# Altium project iMX6 Rex Development Baseboard V1I1.PrjPcb (part 9 of 9)

## Sheet [17] - PWR IN, LEDS, BUTTONS, MECH.SchDoc
size A3; DocumentNumber: 2; SheetNumber: 17; SheetTotal: 20
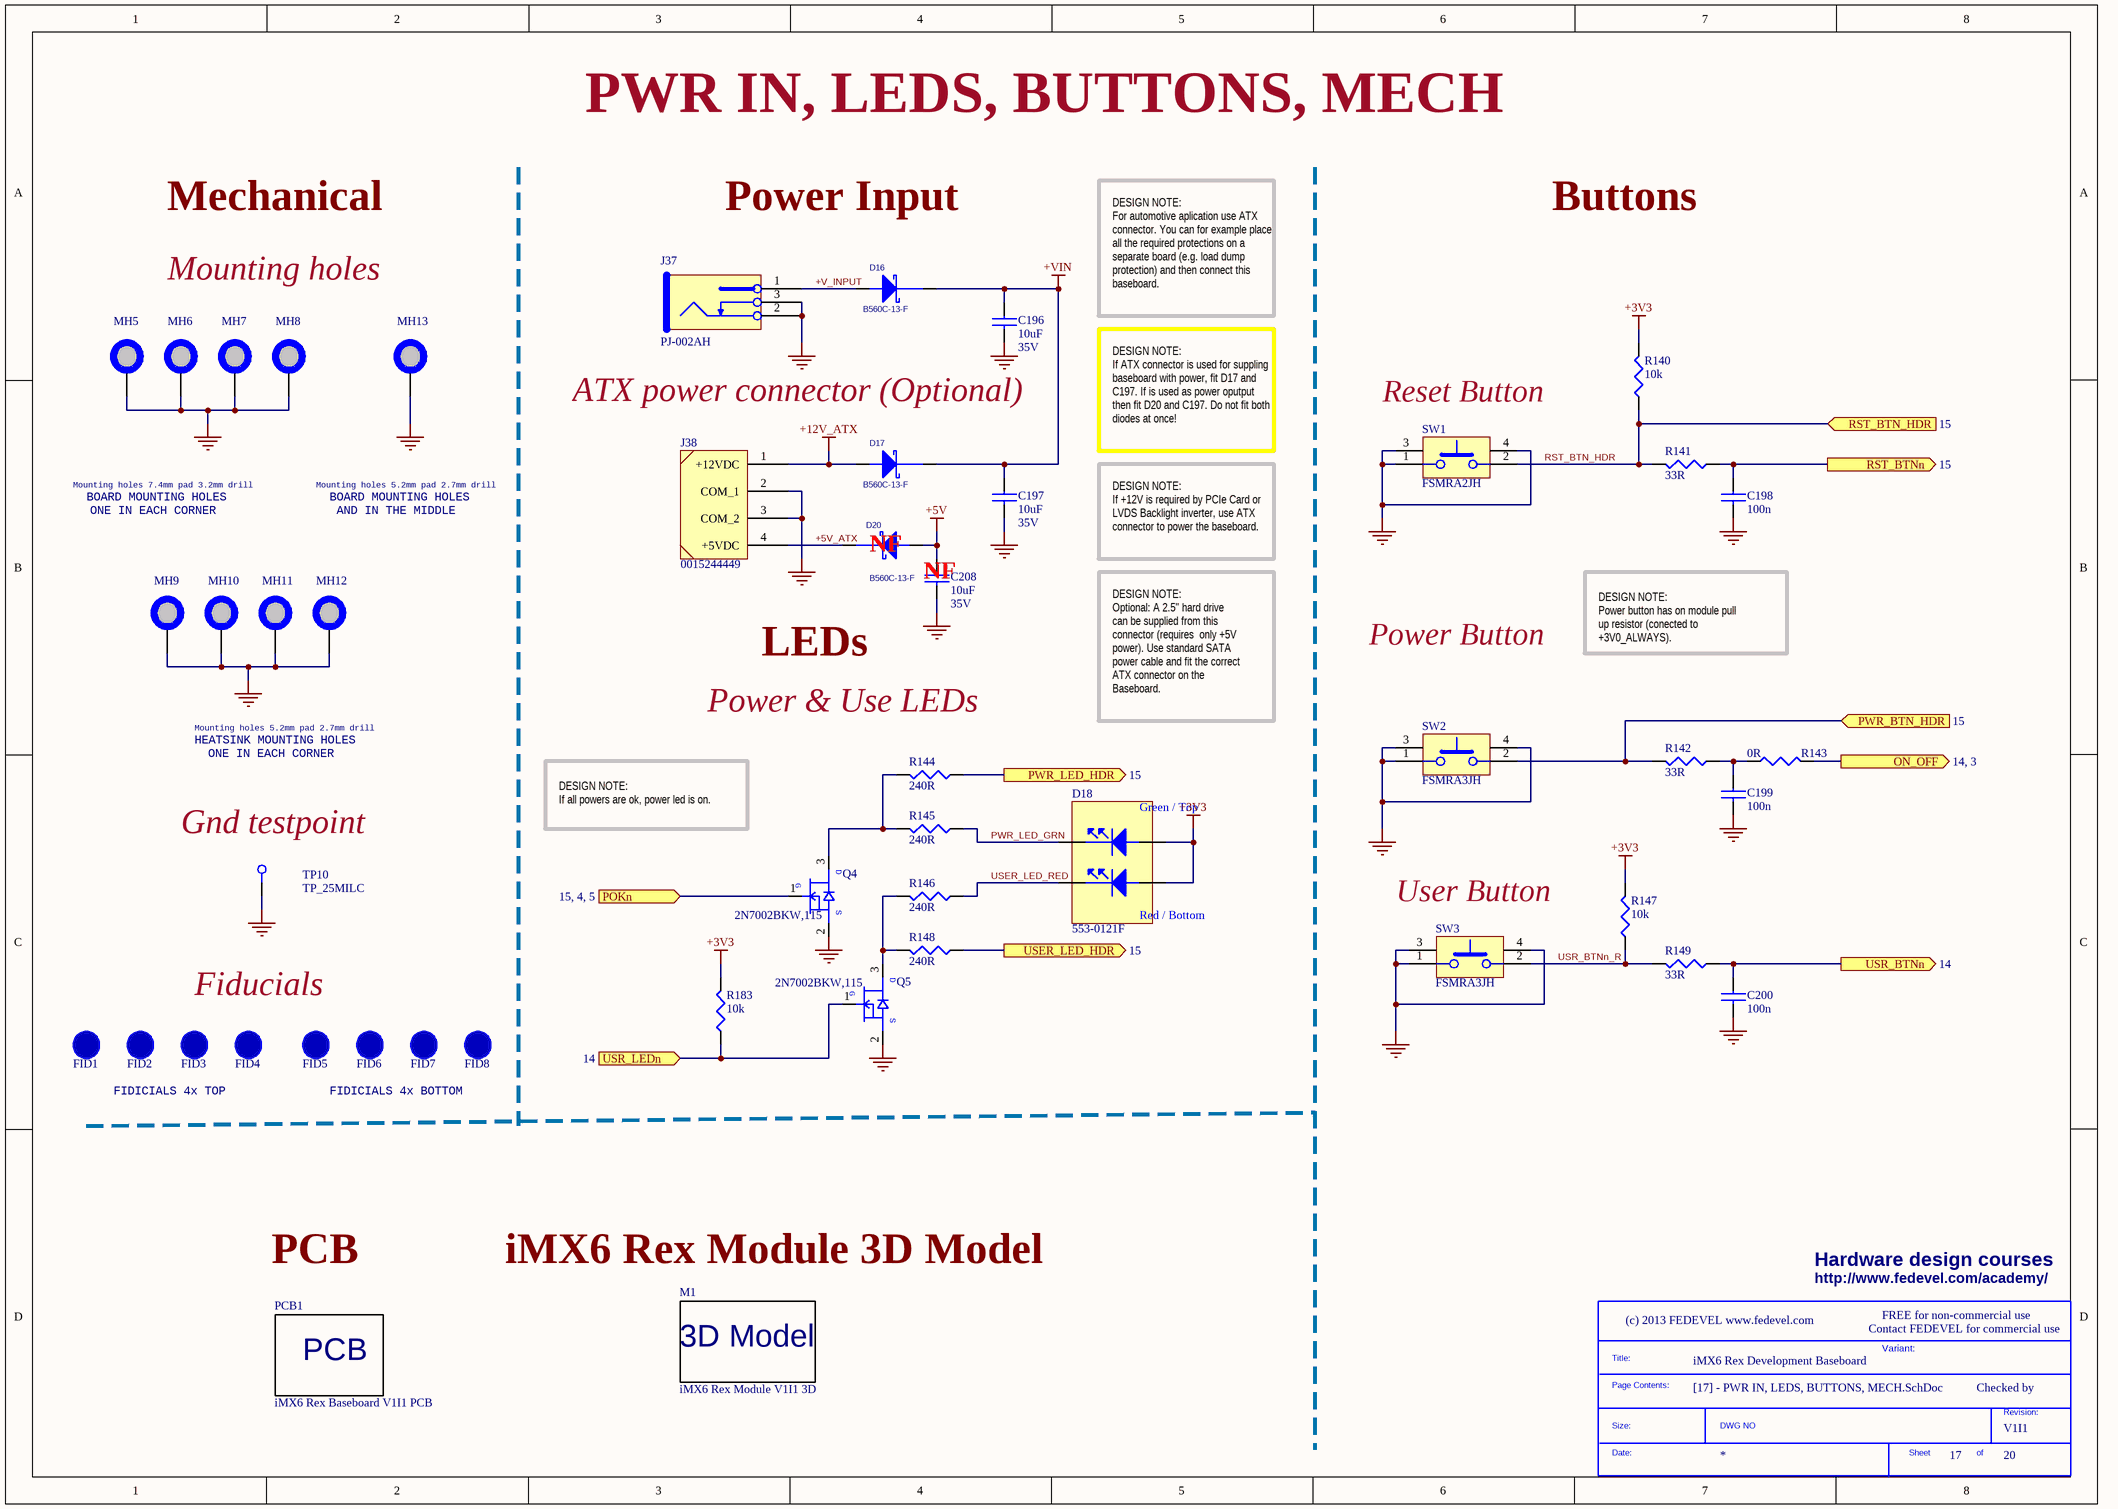
[diagram p23: [17] - PWR IN, LEDS, BUTTONS, MECH.SchDoc]

### Parts
(Parts that share a designator on the sheet are numbered #1, #2 ... from top to bottom, then left to right.)
*#19  SDTitleBlock  (value not drawn)  (graphical)
C196  10uF  Voltage - Rated: 35V  [C1206]
C197  10uF  Voltage - Rated: 35V  [C1206]
C198  100n  [C0402]
C199  100n  [C0402]
C200  100n  [C0402]
C208  10uF  Voltage - Rated: 35V  [C1206]
D16  B560C-13-F  [SMC]
D17  B560C-13-F  [SMC]
D18  553-0121F  [553-0121F]
D20  B560C-13-F  [SMC]
FID1  FID_1MMC  [FID_40X120D]  (value not drawn)  (no BOM)
FID2  FID_1MMC  [FID_40X120D]  (value not drawn)  (no BOM)
FID3  FID_1MMC  [FID_40X120D]  (value not drawn)  (no BOM)
FID4  FID_1MMC  [FID_40X120D]  (value not drawn)  (no BOM)
FID5  FID_1MMC  [FID_40X120D]  (value not drawn)  (no BOM)
FID6  FID_1MMC  [FID_40X120D]  (value not drawn)  (no BOM)
FID7  FID_1MMC  [FID_40X120D]  (value not drawn)  (no BOM)
FID8  FID_1MMC  [FID_40X120D]  (value not drawn)  (no BOM)
J37  PJ-002AH  [POWER_JACK_5.5_2.1MM_NS]
J38  0015244449  [015244449]
M1  iMX6 Rex Module V1I1 3D  [iMX6 Rex Module 3D]  (no BOM)
MH5  MH_7.4MMC_3.2MMD  [MH_7.4MMD_3.2MMD]  (value not drawn)  (no BOM)
MH6  MH_7.4MMC_3.2MMD  [MH_7.4MMD_3.2MMD]  (value not drawn)  (no BOM)
MH7  MH_7.4MMC_3.2MMD  [MH_7.4MMD_3.2MMD]  (value not drawn)  (no BOM)
MH8  MH_7.4MMC_3.2MMD  [MH_7.4MMD_3.2MMD]  (value not drawn)  (no BOM)
MH9  MH_5.2MMC_2.7MMD  [MH_5.2MMD_2.7MMD]  (value not drawn)  (no BOM)
MH10  MH_5.2MMC_2.7MMD  [MH_5.2MMD_2.7MMD]  (value not drawn)  (no BOM)
MH11  MH_5.2MMC_2.7MMD  [MH_5.2MMD_2.7MMD]  (value not drawn)  (no BOM)
MH12  MH_5.2MMC_2.7MMD  [MH_5.2MMD_2.7MMD]  (value not drawn)  (no BOM)
MH13  MH_5MMC_2.2MMD  [MH_5MMD_2.2MMD]  (value not drawn)  (no BOM)
PCB1  iMX6 Rex Baseboard V1I1 PCB  (mechanical)
Q4  2N7002BKW,115  [SC70_SOT323]
Q5  2N7002BKW,115  [SC70_SOT323]
R140  10k  [R0402]
R141  33R  [R0402]
R142  33R  [R0402]
R143  0R  [R0402]
R144  240R  [R0402]
R145  240R  [R0402]
R146  240R  [R0402]
R147  10k  [R0402]
R148  240R  [R0402]
R149  33R  [R0402]
R183  10k  [R0402]
SW1  FSMRA2JH  [FSMRA2JH]
SW2  FSMRA3JH  [FSMRA3JH]
SW3  FSMRA3JH  [FSMRA3JH]
TP10  TP_25MILC  [TP_25C]  (no BOM)

### Ports
ON_OFF (out, see 14, 3), POKn (see 15, 4, 5), PWR_BTN_HDR (in, see 15), PWR_LED_HDR (out, see 15), RST_BTN_HDR (in, see 15), RST_BTNn (out, see 15), USER_LED_HDR (out, see 15), USR_BTNn (out, see 14), USR_LEDn (in, see 14)

### Nets
+3V3: D18.2(ANODE) D18.4(ANODE) R140.2 R147.2 R183.2
+5V: C208.1 D20.2(ANODE)
+12V_ATX: D17.2(ANODE) J38.1(+12VDC)
+VIN: C196.1 C197.1 D16.1(cathode) D17.1(cathode)
GND: C196.2 C197.2 C198.2 C199.2 C200.2 C208.2 J37.2 J37.3 J38.2(COM_1) J38.3(COM_2) MH5.1 MH6.1 MH7.1 MH8.1 MH9.1 MH10.1 MH11.1 MH12.1 MH13.1 Q4.2(SOURCE) Q5.2(SOURCE) SW1.1 SW1.3(MECH1) SW1.4(MECH2) SW2.1 SW2.3(MECH1) SW2.4(MECH2) SW3.1 SW3.3(MECH1) SW3.4(MECH2) TP10.1
+5V_ATX: D20.1(cathode) J38.4(+5VDC)
+V_INPUT: D16.2(ANODE) J37.1
ON_OFF: R143.2 ; port ON_OFF
POKn: Q4.1(GATE) ; port POKn
PWR_BTN_HDR: R142.2 SW2.2 ; port PWR_BTN_HDR
PWR_LED_GRN: D18.3(cathode) R145.1
PWR_LED_HDR: R144.1 ; port PWR_LED_HDR
RST_BTN_HDR: R140.1 R141.2 SW1.2 ; port RST_BTN_HDR
RST_BTNn: C198.1 R141.1 ; port RST_BTNn
USER_LED_HDR: R148.1 ; port USER_LED_HDR
USER_LED_RED: D18.1(cathode) R146.1
USR_BTNn: C200.1 R149.1 ; port USR_BTNn
USR_BTNn_R: R147.1 R149.2 SW3.2
USR_LEDn: Q5.1(GATE) R183.1 ; port USR_LEDn
NetC199_1: C199.1 R142.1 R143.1
NetQ4_3: Q4.3(DRAIN) R144.2 R145.2
NetQ5_3: Q5.3(DRAIN) R146.2 R148.2

### Notes on the sheet
- PWR IN, LEDS, BUTTONS, MECH
- Mechanical
- Power Input
- Buttons
- Mounting holes
- DESIGN NOTE:
  For automotive aplication use ATX connector. You can for example place all the required protections on a separate board (e.g. load dump protection) and then connect this baseboard.
- ATX power connector (Optional)
- DESIGN NOTE:
  If ATX connector is used for suppling baseboard with power, fit D17 and C197. If is used as power oputput then fit D20 and C197. Do not fit both diodes at once!
- (near SW1) Reset Button
- Mounting holes 7.4mm pad 3.2mm drill
- BOARD MOUNTING HOLES
- ONE IN EACH CORNER
- Mounting holes 5.2mm pad 2.7mm drill
- AND IN THE MIDDLE
- (near D20) NF
- (near C208) NF
- DESIGN NOTE:
  If +12V is required by PCIe Card or LVDS Backlight inverter, use ATX connector to power the baseboard.
- Power Button
- DESIGN NOTE:
  Power button has on module pull
  up resistor (conected to
  +3V0_ALWAYS).
- Power & Use LEDs
- LEDs
- DESIGN NOTE:
  Optional: A 2.5" hard drive
  can be supplied from this
  connector (requires  only +5V
  power). Use standard SATA
  power cable and fit the correct
  ATX connector on the
  Baseboard.
- HEATSINK MOUNTING HOLES
- (near TP10) Gnd testpoint
- DESIGN NOTE:
  If all powers are ok, power led is on.
- User Button
- Fiducials
- FIDICIALS 4x TOP
- FIDICIALS 4x BOTTOM
- Hardware design courses
- PCB
- iMX6 Rex Module 3D Model
- http://www.fedevel.com/academy/
- Contact FEDEVEL for commercial use
- FREE for non-commercial use
- Variant:
- Checked by
- (in symbol 2N7002BKW,115) D; G; S
- (in symbol 553-0121F) Green / Top; Red / Bottom
- (in symbol PCB_iMX6_REX_Baseboard_V1I1) PCB
- (in symbol SDTitleBlock) Title:; Page Contents:; Revision:; Size:; DWG NO; Date:; Sheet; of

### Library data of the parts
C196 C197 C208 = GRM31CR6YA106KA12L: as C184 on sheet [16] - POWERS 5V, 3V3; Category: Capacitors; Supplier Part Number: 490-5524-1-ND; Manufacturer Part Number: GRM31CR6YA106KA12L; Operating Temperature: -55°C ~ 85°C; Package / Case: 1206 (3216 Metric); Price 1k [$]: 0.19448; Value: 10uF; .Checked SCH: used; Supplier: Digikey; Supplier 1: Digi-Key; Supplier Part Number 1: 490-5524-1-ND; RoHS: RoHS Compliant; Stock 1: 76334; Pricing 1: 1=0.6, 10=0.501, 50=0.359, 100=0.3142, 250=0.24684, 500=0.2244, 1000=0.17952 (USD); Temperature Coefficient: X5R; Mounting Type: Surface Mount, MLCC; Applications: General Purpose; Ratings: -; Size / Dimension: 0.126" L x 0.063" W (3.20mm x 1.60mm); Height - Seated (Max): -; Thickness (Max): 0.071" (1.80mm); Lead Spacing: -; Features: -; Packaging: Cut Tape (CT); Lead Style: -; ComponentLink1URL: http://www.murata.com/products/catalog/pdf/c02e.pdf; ComponentLink1Description: http://www.murata.com/products/catalog/pdf/c02e.pdf
C198-C200 = C1005X5R1H104K: as C151-C155 on sheet [14] - RTC, EEPROM, GPIO, TOUCH SCREEN; Category: Capacitors; Supplier Part Number: 445-5942-1-ND; Manufacturer Part Number: C1005X5R1H104K; Operating Temperature: -55°C ~ 85°C; Package / Case: 0402 (1005 Metric); Price 1k [$]: 0.02340; .Checked SCH: used; Voltage - Rated: 50V; Supplier: Digikey; Supplier 1: Digi-Key; Supplier Part Number 1: 445-5942-1-ND; RoHS: RoHS Compliant; Stock 1: 106926; Pricing 1: 1=0.27, 10=0.18, 100=0.072, 250=0.05176, 500=0.0369, 1000=0.027 (USD); Tolerance: ±10%; Temperature Coefficient: X5R; Mounting Type: Surface Mount, MLCC; Applications: General Purpose; Ratings: -; Size / Dimension: 0.039" L x 0.020" W (1.00mm x 0.50mm); Height - Seated (Max): -; Thickness (Max): 0.022" (0.55mm); Lead Spacing: -; Features: -; Packaging: Cut Tape (CT); Lead Style: -; ComponentLink1URL: http://www.tdk.co.jp/tefe02/e412_c.pdf; ComponentLink1Description: http://www.tdk.co.jp/tefe02/e412_c.pdf
D16 D17 D20 = B560C-13-F: DIODE SCHOTTKY 60V 5A SMC; Manufacturer: Diodes Inc; .Checked PCB: used; Voltage - Forward (Vf) (Max) @ If: 700mV @ 5A; Speed: Fast Recovery =< 500ns, > 200mA (Io); Current - Reverse Leakage @ Vr: 500µA @ 60V; Capacitance @ Vr, F: 300pF @ 4V, 1MHz; .Checked SCH: used; Category: Discrete Semiconductor Products; Supplier Part Number: B560C-FDICT-ND; Manufacturer Part Number: B560C-13-F; Price 1k [$]: 0.42900; Value: B560C-13-F; Package / Case: DO-214AB, SMC; Supplier: Digikey; Family: Diodes, Rectifiers - Single; Voltage - DC Reverse (Vr) (Max): 60V; Current - Average Rectified (Io): 5A; Diode Type: Schottky; Supplier 1: Digi-Key; Supplier Part Number 1: B560C-FDICT-ND; RoHS: RoHS Compliant; Stock 1: 37770; Pricing 1: 1=0.99, 10=0.884, 100=0.702, 250=0.611, 500=0.546, 1000=0.429 (USD); Reverse Recovery Time (trr): -; Mounting Type: Surface Mount; Supplier Device Package: SMC; Packaging: Cut Tape (CT); ComponentLink1URL: http://www.diodes.com/datasheets/ds13012.pdf; ComponentLink1Description: http://www.diodes.com/datasheets/ds13012.pdf
D18 = 553-0121F: LED 2HI 3MM GREEN OVER RED PCMNT; Manufacturer: Dialight; .Checked PCB: used; Color: Green, Red; Wavelength - Peak: 563nm, 650nm; Voltage Rating: 2.1V Green, 2V Red; Current: 10mA; Millicandela Rating: 16mcd Green, 10mcd Red; Lens Type: Diffused, Tinted; Lens Style/Size: Round with Domed Top, 3mm; Configuration: 2 High; .Checked SCH: used; Category: Optoelectronics; Family: LEDs - Circuit Board Indicators, Arrays, Light Bars, Bar Graphs; Manufacturer Part Number: 553-0121F; Price 1k [$]: 0.63000; Supplier: Digikey; Supplier Part Number: 350-1822-ND; Value: 553-0121F; Supplier 1: Digi-Key; Supplier Part Number 1: 350-1822-ND; RoHS: RoHS Compliant; Stock 1: 5551; Pricing 1: 1=1.68, 25=1.05, 100=0.945, 250=0.84, 500=0.714, 1000=0.588, 5000=0.525 (USD); Viewing Angle: -; Mounting Type: Through Hole, Right Angle; Packaging: Bulk; ComponentLink1URL: http://www.dialight.com/Assets/Drawings/2D_Drawings_DrawingDetailedSpec/C17277.pdf; ComponentLink1Description: http://www.dialight.com/Assets/Drawings/2D_Drawings_DrawingDetailedSpec/C17277.pdf
FID1-FID8 = FID_1MMC: Fiducial 40mil Diameter, 120mil Mask; Supplier: Digikey
J37 = PJ-002AH: CONN PWR JACK 2.1X5.5MM HIGH CUR; Manufacturer: CUI Inc; .Checked PCB: used; Mating connector: 2.1mm ID, 5.5mm OD; Gender: Male; Number of Positions/Contacts: 2 Conductors, 3 Contacts; Internal Switch(s): Single Switch, Normally Closed; Shielding: Unshielded; Voltage - Rated: 24VDC; Current Rating: 5A; .Checked SCH: used; Category: Connectors, Interconnects; Family: Barrel - Power; Manufacturer Part Number: PJ-002AH; Operating Temperature: -25°C ~ 85°C; Price 1k [$]: 0.23625; Supplier: Digikey; Supplier Part Number: CP-002AH-ND; Value: PJ-002AH; Supplier 1: Digi-Key; Supplier Part Number 1: CP-002AH-ND; RoHS: RoHS Compliant; Stock 1: 138933; Pricing 1: 1=1.01, 10=0.704, 100=0.4724, 500=0.3819, 1000=0.3417, 2500=0.27135 (USD); Connector Type: Jack; Plug/Mating Plug Diameter: 2.1mm ID, 5.5mm OD; Mounting Type: Through Hole, Right Angle; Termination: Solder Eyelet(s); Features: -; Color: Black; Contact Material: Copper Alloy; Contact Material - Plating: Nickel; Housing Color: Black; Housing Material: Thermoplastic; ComponentLink1URL: http://products.cui.com/GetSpecForDigiKey.aspx?MFGNum=PJ-002AH; ComponentLink1Description: http://products.cui.com/GetSpecForDigiKey.aspx?MFGNum=PJ-002AH
J38 = 0015244449: CONN HEADER 4POS .200 VERT; Manufacturer: Molex Inc; Connector Type: Header, Shrouded; Number of Positions: 4; Number of Positions Loaded: All; Pitch: 0.200" (5.08mm); .Creator: MM; Supplier 1: Digi-Key; Manufacturer Part Number: 0015244449; RoHS: RoHS Compliant; Category: Connectors, Interconnects; Stock 1: 933; Pricing 1: 1=0.83, 10=0.729, 25=0.6864, 50=0.6578, 100=0.6292, 250=0.572, 500=0.5148, 1000=0.4576, 2500=0.4147 (USD); Packaging: Tray; Contact Type: Male Pin; Number of Rows: 1; Row Spacing: -; Contact Mating Length: 0.171" (4.34mm); Mounting Type: Through Hole; Termination: Solder; Fastening Type: Locking Ramp; Features: -; Contact Finish: Tin; Contact Finish Thickness: 100µin (2.54µm); Color: Beige; ComponentLink1URL: http://www.molex.com/pdm_docs/sd/015244449_sd.pdf; ComponentLink1Description: http://www.molex.com/pdm_docs/sd/015244449_sd.pdf; Supplier Part Number 1: WM9132-ND; .Checked PCB: MM; .Checked SCH: MM
M1 = 3D_iMX6_REX_MODULE_V1I1: Printed Circuit Board; .Creator: MM; Category: 3D Model
MH5-MH8 = MH_7.4MMC_3.2MMD: Mounting Hole 7.4mm Diameter, 3.2mm Drill
MH9-MH12 = MH_5.2MMC_2.7MMD: Mounting Hole 5.2mm Diameter, 2.7mm Drill; .Creator: MM
MH13 = MH_5MMC_2.2MMD: Mounting Hole 5mm Diameter, 2.2mm Drill
PCB1 = PCB_iMX6_REX_Baseboard_V1I1: Printed Circuit Board; .Creator: MM; Category: Printed circuits board; .Checked SCH: MM
Q4 Q5 = 2N7002BKW,115: as Q6 on sheet [13] - UARTS; Supplier 1: Digi-Key; Supplier Part Number 1: 568-5980-1-ND; Manufacturer Part Number: 2N7002BKW,115; RoHS: RoHS Compliant; Category: Discrete Semiconductor Products; Stock 1: 15666; Pricing 1: 1=0.39, 10=0.354, 25=0.2548, 100=0.1983, 250=0.12456, 500=0.10616, 1000=0.07233 (USD); Drain to Source Voltage (Vdss): 60V; Current - Continuous Drain (Id) @ 25° C: 310mA; Mounting Type: Surface Mount; Package / Case: SC-70, SOT-323; Supplier Device Package: SC-70; Packaging: Cut Tape (CT); ComponentLink1URL: http://www.nxp.com/documents/data_sheet/2N7002BKW.pdf; ComponentLink1Description: http://www.nxp.com/documents/data_sheet/2N7002BKW.pdf; .Checked SCH: RF
R140 R147 R183 = RC0402FR-0710KL: as R108 on sheet [13] - UARTS; Category: Resistors; Supplier Part Number: 311-10.0KLRCT-ND; Manufacturer Part Number: RC0402FR-0710KL; Package / Case: 0402 (1005 Metric); Price 1k [$]: 0.01421; Resistance (Ohms): 10K; Tolerance: ±1%; Value: 10k; .Checked SCH: used; Supplier: Digikey; Supplier 1: Digi-Key; Supplier Part Number 1: 311-10.0KLRCT-ND; RoHS: RoHS Compliant; Stock 1: 2916495; Pricing 1: 10=0.014, 50=0.0104, 100=0.0079, 250=0.00584, 500=0.00432, 1000=0.00288 (USD); Composition: Thick Film; Features: -; Size / Dimension: 0.039" L x 0.020" W (1.00mm x 0.50mm); Height: 0.016" (0.40mm); Number of Terminations: 2; Packaging: Cut Tape (CT); ComponentLink1URL: http://www.yageo.com/documents/recent/PYu-RC0402_51_RoHS_L_6.pdf; ComponentLink1Description: http://www.yageo.com/documents/recent/PYu-RC0402_51_RoHS_L_6.pdf
R141 R142 R149 = RMCF0402FT33R0: RES TF 33 OHM 1% 1/16W 0402; Manufacturer: Stackpole Electronics Inc; Resistance (Ohms): 33; Power (Watts): 0.063W, 1/16W; .Checked PCB: RF; Temperature Coefficient: ±100ppm/°C; Category: Resistors; Supplier Part Number: RMCF0402FT33R0CT-ND; Manufacturer Part Number: RMCF0402FT33R0; Package / Case: 0402 (1005 Metric); Price 1k [$]: 0.00384; Tolerance: ±1%; Value: 33R; .Checked SCH: RF; Supplier: Digikey; Supplier 1: Digi-Key; Supplier Part Number 1: RMCF0402FT33R0CT-ND; RoHS: RoHS Compliant; Stock 1: 26866; Pricing 1: 1=0.04, 10=0.025, 50=0.0138, 100=0.0105, 250=0.0078, 500=0.00576, 1000=0.00384 (USD); Composition: Thick Film; Features: -; Size / Dimension: 0.039" L x 0.020" W (1.00mm x 0.50mm); Height: 0.016" (0.40mm); Number of Terminations: 2; Packaging: Cut Tape (CT); ComponentLink1URL: http://www.seielect.com/Catalog/SEI-RMCF.pdf; ComponentLink1Description: http://www.seielect.com/Catalog/SEI-RMCF.pdf
R143 = RC0402JR-070RL: as R112 on sheet [14] - RTC, EEPROM, GPIO, TOUCH SCREEN; Category: Resistors; Supplier Part Number: 311-0.0JRCT-ND; Manufacturer Part Number: RC0402JR-070RL; Package / Case: 0402 (1005 Metric); Price 1k [$]: 0.01389; Value: 0R; .Checked SCH: used; Supplier: Digikey; Supplier 1: Digi-Key; Supplier Part Number 1: 311-0.0JRCT-ND; RoHS: RoHS Compliant; Stock 1: 1106330; Pricing 1: 10=0.012, 50=0.009, 100=0.0069, 250=0.00512, 500=0.0038, 1000=0.00253 (USD); Composition: Thick Film; Features: -; Temperature Coefficient: -; Size / Dimension: 0.039" L x 0.020" W (1.00mm x 0.50mm); Height: 0.016" (0.40mm); Number of Terminations: 2; Packaging: Cut Tape (CT); ComponentLink1URL: http://www.yageo.com/documents/recent/PYu-RC0402_51_RoHS_L_6.pdf; ComponentLink1Description: http://www.yageo.com/documents/recent/PYu-RC0402_51_RoHS_L_6.pdf
R144-R146 R148 = RMCF0402FT240R: RES TF 240 OHM 1% 0.0625W 0402; Manufacturer: Stackpole Electronics Inc; Resistance (Ohms): 240; Power (Watts): 0.063W, 1/16W; .Checked PCB: used; Temperature Coefficient: ±100ppm/°C; Category: Resistors; Supplier Part Number: RMCF0402FT240RCT-ND; Manufacturer Part Number: RMCF0402FT240R; Package / Case: 0402 (1005 Metric); Price 1k [$]: 0.00384; Tolerance: ±1%; Value: 240R; .Checked SCH: used; Supplier: Digikey; Supplier 1: Digi-Key; Supplier Part Number 1: RMCF0402FT240RCT-ND; RoHS: RoHS Compliant; Stock 1: 39860; Pricing 1: 1=0.04, 10=0.025, 50=0.0138, 100=0.0105, 250=0.0078, 500=0.00576, 1000=0.00384 (USD); Composition: Thick Film; Features: -; Size / Dimension: 0.039" L x 0.020" W (1.00mm x 0.50mm); Height: 0.016" (0.40mm); Number of Terminations: 2; Packaging: Cut Tape (CT); ComponentLink1URL: http://www.seielect.com/Catalog/SEI-RMCF.pdf; ComponentLink1Description: http://www.seielect.com/Catalog/SEI-RMCF.pdf
SW1 = FSMRA2JH: SWITCH TACTILE SPST-NO 0.05A 12V; Manufacturer: TE Connectivity; Switch Function: Off-Mom; Contact Rating @ Voltage: 0.05A @ 12VDC; Actuator Type: Standard; Actuator Height off PCB, from Pins: 3.86mm; Actuator Orientation: Side Actuated; Outline: 7.10mm x 7.00mm; Illumination: Non-Illuminated; Operating Force: 160gf; Actuator Material: Polybutylene Terephthalate (PBT); Switch Travel: 0.25mm; Mechanical Life: 100,000 Cycles; .Creator: MM; Supplier 1: Digi-Key; Manufacturer Part Number: FSMRA2JH; RoHS: RoHS Compliant; Category: Switches; Stock 1: 12215; Pricing 1: 1=0.16, 10=0.151, 25=0.146, 50=0.141, 100=0.1331, 250=0.12528, 500=0.12006, 1000=0.09135 (USD); Packaging: Bulk; Circuit: SPST-NO; Mounting Type: Through Hole, Right Angle; Termination Style: PC Pin; Illumination Voltage (Nominal): -; Illumination Type, Color: -; Ingress Protection: -; Features: -; Operating Temperature: -35°C ~ 85°C; ComponentLink1URL: http://media.digikey.com/pdf/Data%20Sheets/Tyco%20Electronics%20Alcoswitch%20PDFs/FSM%20Series.pdf; ComponentLink1Description: http://media.digikey.com/pdf/Data%20Sheets/Tyco%20Electronics%20Alcoswitch%20PDFs/FSM%20Series.pdf; Supplier Part Number 1: 450-1662-ND; .Checked PCB: MM; .Checked SCH: MM
SW2 SW3 = FSMRA3JH: SWITCH TACTILE SPST-NO 0.05A 12V; Manufacturer: TE Connectivity; Switch Function: Off-Mom; Contact Rating @ Voltage: 0.05A @ 12VDC; Actuator Type: Standard; Actuator Height off PCB, from Pins: 5.85mm; Actuator Orientation: Side Actuated; Outline: 7.10mm x 7.00mm; Illumination: Non-Illuminated; Operating Force: 160gf; Actuator Material: Polyamide (PA), Nylon; Switch Travel: 0.25mm; Mechanical Life: 100,000 Cycles; .Creator: MM; Supplier 1: Digi-Key; Manufacturer Part Number: FSMRA3JH; RoHS: RoHS Compliant; Category: Switches; Stock 1: 37985; Pricing 1: 1=0.15, 10=0.143, 25=0.1376, 50=0.1328, 100=0.1255, 250=0.11808, 500=0.11316, 1000=0.0861 (USD); Packaging: Bulk; Circuit: SPST-NO; Mounting Type: Through Hole, Right Angle; Termination Style: PC Pin; Illumination Voltage (Nominal): -; Illumination Type, Color: -; Ingress Protection: -; Features: -; Operating Temperature: -35°C ~ 85°C; ComponentLink1URL: http://www.te.com/commerce/DocumentDelivery/DDEController?Action=srchrtrv&DocNm=1825027&DocType=Customer+Drawing&DocLang=English; ComponentLink1Description: http://www.te.com/commerce/DocumentDelivery/DDEController?Action=srchrtrv&DocNm=1825027&DocType=Customer+Drawing&DocLang=English; Supplier Part Number 1: 450-1657-ND; .Checked PCB: MM; .Checked SCH: MM
TP10 = TP_25MILC: Test Point 25mil

## Sheet [18] - DOC, POWER SEQUENCING.SchDoc
size A3; DocumentNumber: 2; SheetNumber: 18; SheetTotal: 20
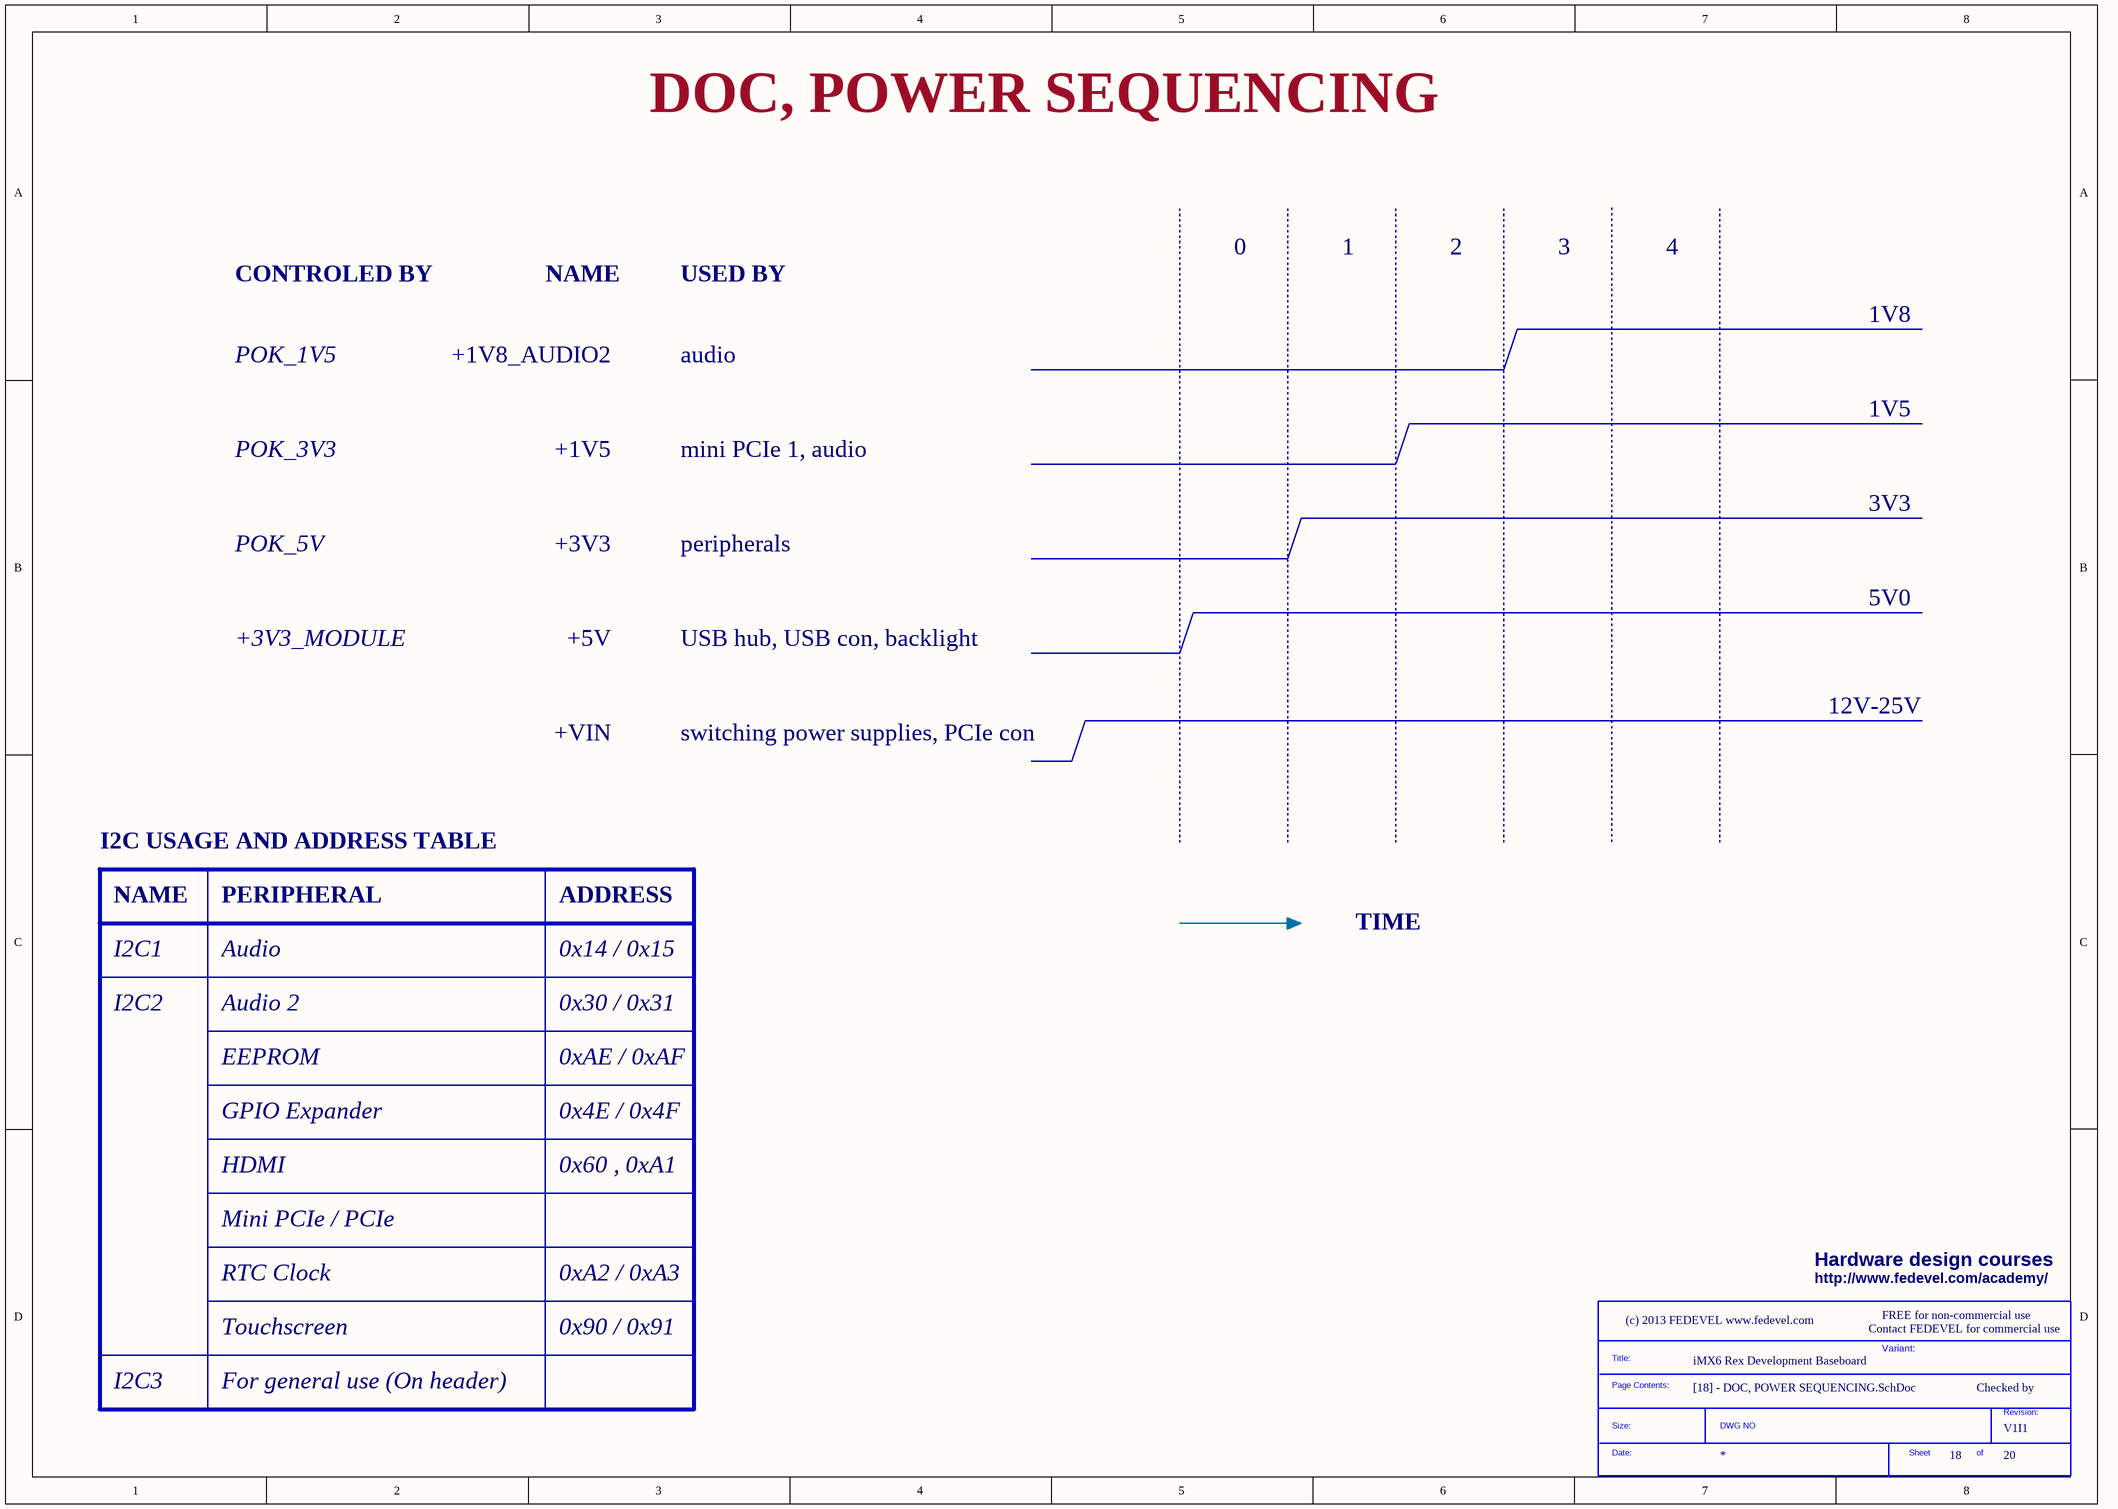
[diagram p24: [18] - DOC, POWER SEQUENCING.SchDoc]

### Parts
(Parts that share a designator on the sheet are numbered #1, #2 ... from top to bottom, then left to right.)
*#20  SDTitleBlock  (value not drawn)  (graphical)

### Notes on the sheet
- DOC, POWER SEQUENCING
- CONTROLED BY
- NAME
- USED BY
- 0
- 1
- 2
- 3
- 4
- POK_1V5
- +1V8_AUDIO2
- audio
- 1V8
- 1V5
- POK_3V3
- +1V5
- mini PCIe 1, audio
- 3V3
- POK_5V
- +3V3
- peripherals
- +3V3_MODULE
- +5V
- USB hub, USB con, backlight
- 5V0
- 12V-25V
- +VIN
- switching power supplies, PCIe con
- I2C USAGE AND ADDRESS TABLE
- PERIPHERAL
- ADDRESS
- I2C1
- Audio
- 0x14 / 0x15
- TIME
- I2C2
- Audio 2
- 0x30 / 0x31
- EEPROM
- GPIO Expander
- 0xAE / 0xAF
- 0x4E / 0x4F
- HDMI
- 0x60 , 0xA1
- Mini PCIe / PCIe
- Hardware design courses
- RTC Clock
- 0xA2 / 0xA3
- http://www.fedevel.com/academy/
- Contact FEDEVEL for commercial use
- FREE for non-commercial use
- I2C3
- For general use (On header)
- Touchscreen
- 0x90 / 0x91
- Variant:
- Checked by
- (in symbol SDTitleBlock) Title:; Page Contents:; Revision:; Size:; DWG NO; Date:; Sheet; of

## Sheet [19] - REVISION HISTORY.SchDoc
size A3; DocumentNumber: 2; SheetNumber: 19; SheetTotal: 20
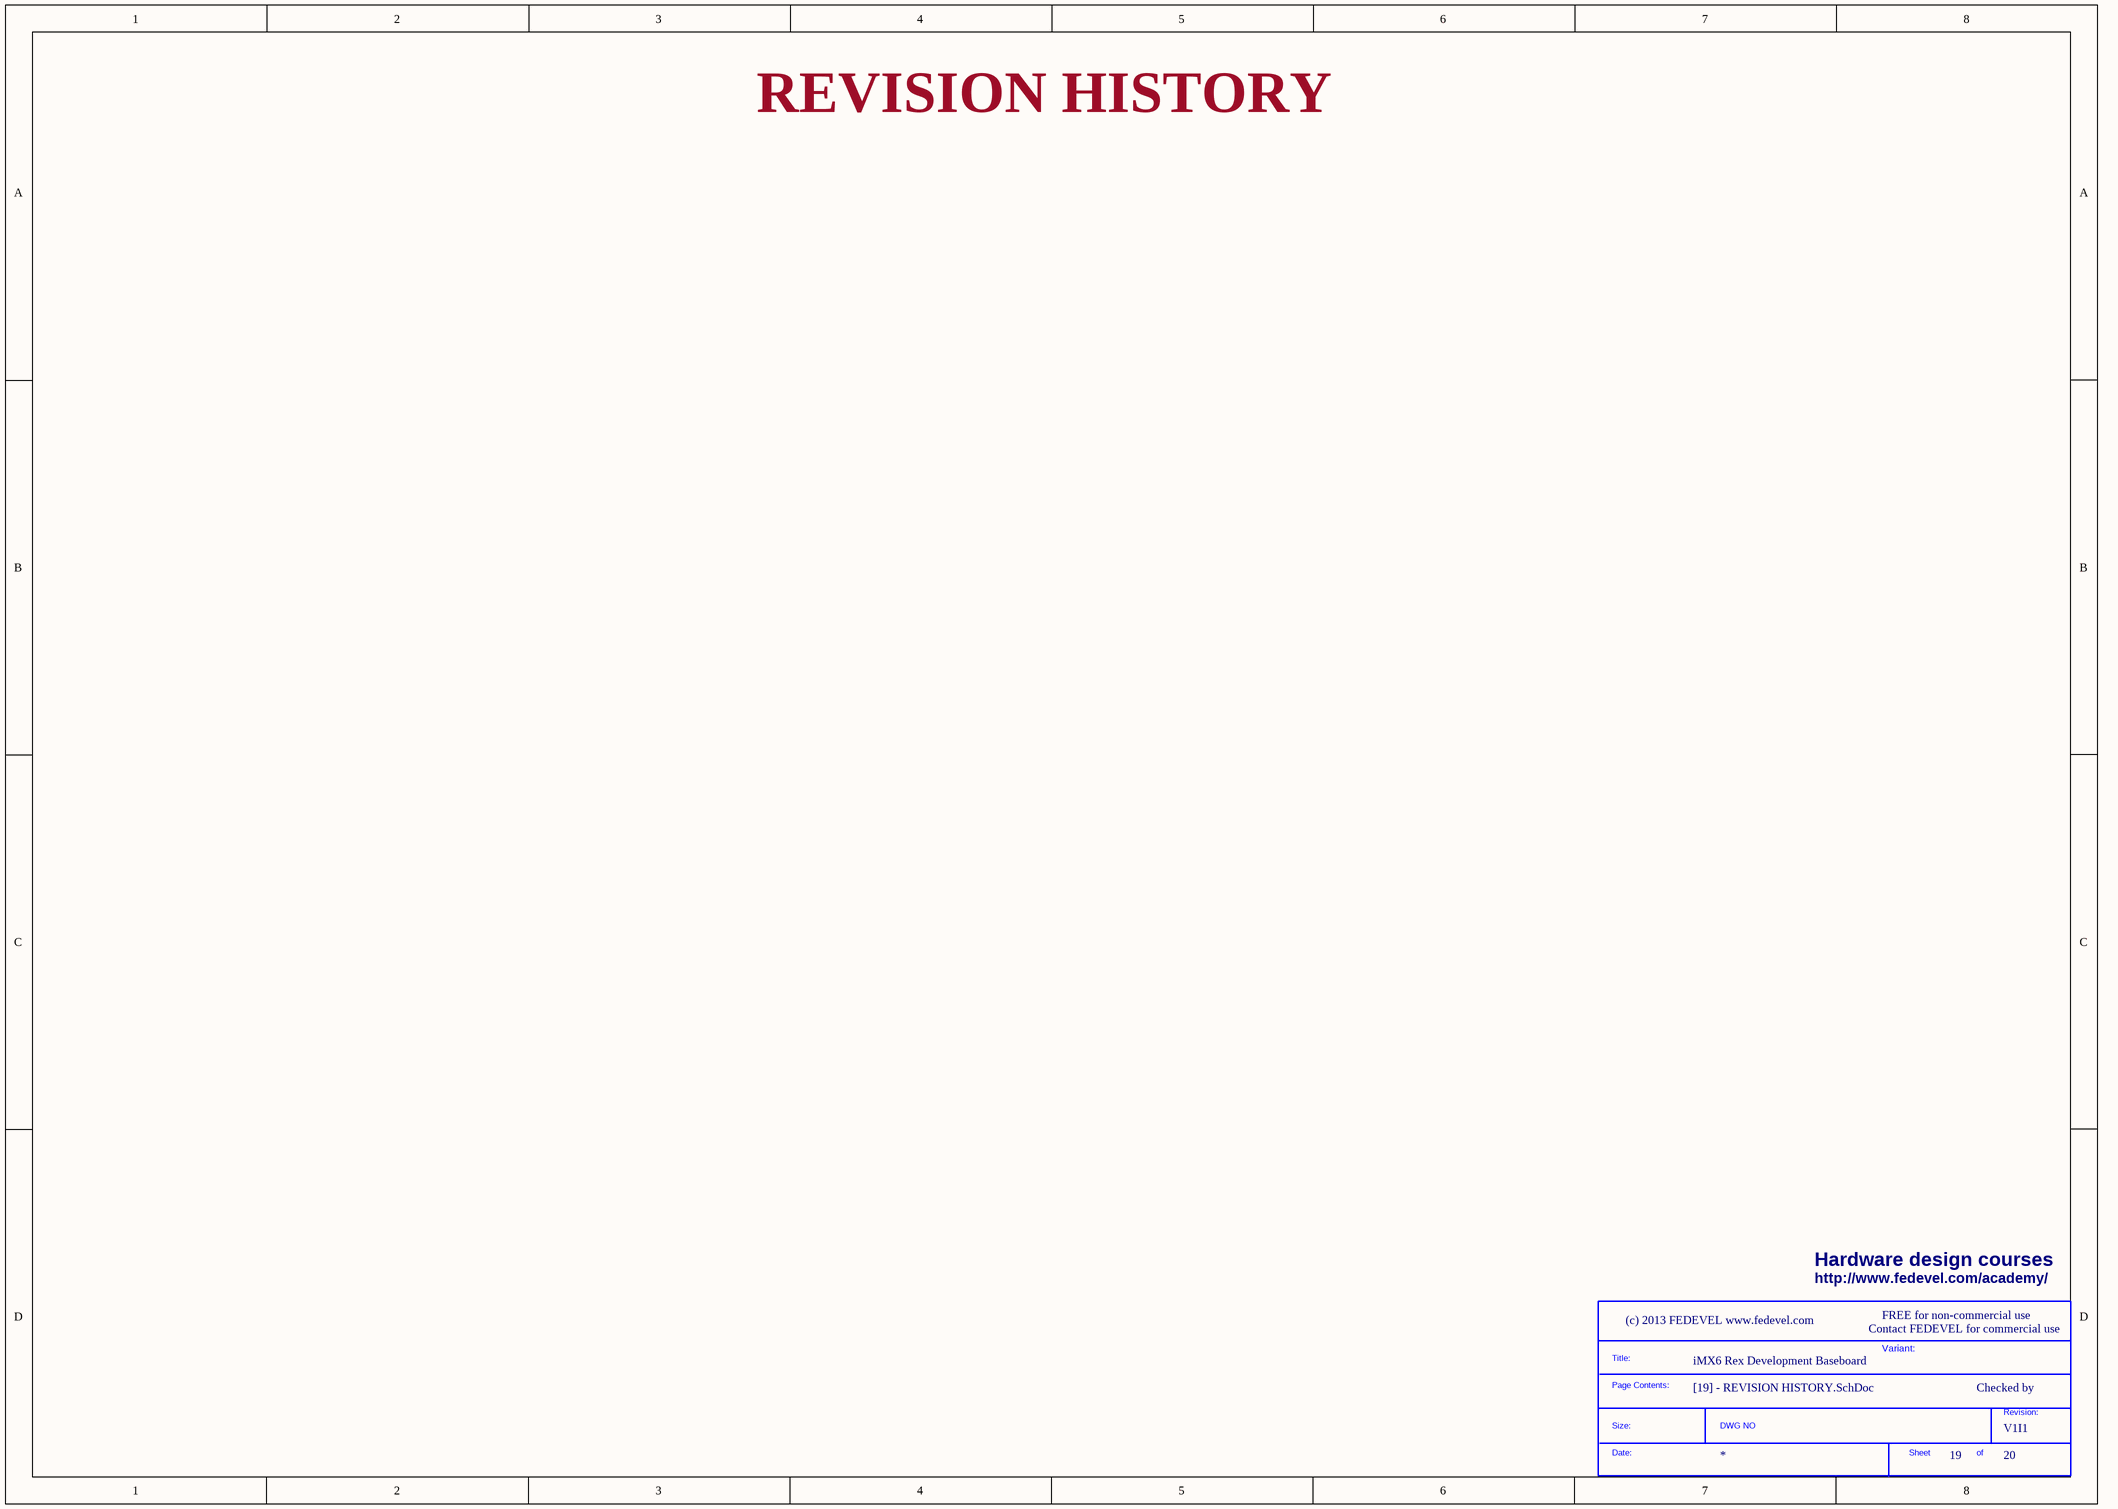
[diagram p25: [19] - REVISION HISTORY.SchDoc]

### Parts
(Parts that share a designator on the sheet are numbered #1, #2 ... from top to bottom, then left to right.)
*#21  SDTitleBlock  (value not drawn)  (graphical)

### Notes on the sheet
- REVISION HISTORY
- Hardware design courses
- http://www.fedevel.com/academy/
- Contact FEDEVEL for commercial use
- FREE for non-commercial use
- Variant:
- Checked by
- (in symbol SDTitleBlock) Title:; Page Contents:; Revision:; Size:; DWG NO; Date:; Sheet; of

## Nets that join several sheets
+1V5: [04] - PCIE MINI 1, PCIE (6 pins), [05] - PCIE MINI 2, AUDIO2 (FB2.2), [11] - AUDIO1 (FB10.1)
+1V8_AUDIO2: [05] - PCIE MINI 2, AUDIO2 (13 pins), [11] - AUDIO1 (FB11.2 FB26.2)
+3V3: [04] - PCIE MINI 1, PCIE (21 pins), [05] - PCIE MINI 2, AUDIO2 (9 pins), [06] - SATA, CFAST (5 pins), [07] - HDMI (D7.2 R46.2), [08] - LVDS (8 pins), [09] - USB (FB7.1), [10] - ETHERNET (C115.1 J24.10 J24.12), [11] - AUDIO1 (C126.1 FB12.1 FB13.2), [12] - SD (5 pins), [13] - UARTS (6 pins), [14] - RTC, EEPROM, GPIO, TOUCH SCREEN (17 pins), [15] - MISC, JTAG, HEADERS (22 pins), [16] - POWERS 5V, 3V3 (7 pins), [17] - PWR IN, LEDS, BUTTONS, MECH (5 pins)
+3V3_MODULE: [03] - CONNECTORS (C4.1 J2.50), [16] - POWERS 5V, 3V3 (C207.1 R128.1 U15.3)
+5V: [03] - CONNECTORS (R159.2), [05] - PCIE MINI 2, AUDIO2 (FB4.1), [07] - HDMI (C71.1 U7.1), [08] - LVDS (5 pins), [09] - USB (7 pins), [15] - MISC, JTAG, HEADERS (C177.1 C178.1 J35.1 J35.4), [16] - POWERS 5V, 3V3 (6 pins), [17] - PWR IN, LEDS, BUTTONS, MECH (C208.1 D20.2)
+12V_ATX: [04] - PCIE MINI 1, PCIE (8 pins), [08] - LVDS (J18.1), [17] - PWR IN, LEDS, BUTTONS, MECH (D17.2 J38.1)
+VIN: [03] - CONNECTORS (7 pins), [08] - LVDS (R56.2), [16] - POWERS 5V, 3V3 (7 pins), [17] - PWR IN, LEDS, BUTTONS, MECH (C196.1 C197.1 D16.1 D17.1)
GND: [03] - CONNECTORS (18 pins), [04] - PCIE MINI 1, PCIE (68 pins), [05] - PCIE MINI 2, AUDIO2 (94 pins), [06] - SATA, CFAST (19 pins), [07] - HDMI (26 pins), [08] - LVDS (31 pins), [09] - USB (61 pins), [10] - ETHERNET (8 pins), [11] - AUDIO1 (38 pins), [12] - SD (18 pins), [13] - UARTS (19 pins), [14] - RTC, EEPROM, GPIO, TOUCH SCREEN (25 pins), [15] - MISC, JTAG, HEADERS (33 pins), [16] - POWERS 5V, 3V3 (30 pins), [17] - PWR IN, LEDS, BUTTONS, MECH (31 pins)
AUD3_CLK: [03] - CONNECTORS (J2.20), [11] - AUDIO1 (U14.21)
AUD3_RXD: [03] - CONNECTORS (J2.22), [11] - AUDIO1 (U14.25)
AUD3_TXC: [03] - CONNECTORS (J2.16), [11] - AUDIO1 (U14.24)
AUD3_TXD: [03] - CONNECTORS (J2.18), [11] - AUDIO1 (U14.26)
AUD3_TXFS: [03] - CONNECTORS (J2.24), [11] - AUDIO1 (U14.23)
BOOT_MODE: [03] - CONNECTORS (J1.50), [15] - MISC, JTAG, HEADERS (JP2.1)
BUF_SYS_RSTn: [04] - PCIE MINI 1, PCIE (J4.22 R13.2), [05] - PCIE MINI 2, AUDIO2 (J9.22), [09] - USB (R170.2), [15] - MISC, JTAG, HEADERS (J33.6 U20.4)
CLK1_N: [03] - CONNECTORS (J2.46), [04] - PCIE MINI 1, PCIE (R1.1 R2.1)
CLK1_P: [03] - CONNECTORS (J2.48), [04] - PCIE MINI 1, PCIE (R3.1 R4.1)
CPU_INT: [03] - CONNECTORS (J1.37), [05] - PCIE MINI 2, AUDIO2 (J9.1), [13] - UARTS (Q6.3), [14] - RTC, EEPROM, GPIO, TOUCH SCREEN (R112.2 U19.22), [15] - MISC, JTAG, HEADERS (J33.8)
CSPI2_CLK: [03] - CONNECTORS (J1.17), [15] - MISC, JTAG, HEADERS (J33.14)
CSPI2_CS0: [03] - CONNECTORS (J1.19), [15] - MISC, JTAG, HEADERS (J33.10)
CSPI2_MISO: [03] - CONNECTORS (J1.21), [15] - MISC, JTAG, HEADERS (J33.11)
CSPI2_MOSI: [03] - CONNECTORS (J1.23), [15] - MISC, JTAG, HEADERS (J33.12)
ENET_LED_LINK: [03] - CONNECTORS (J1.56), [10] - ETHERNET (J24.11)
ENET_LED_RX: [03] - CONNECTORS (J1.55), [10] - ETHERNET (J24.9)
GPIO0: [14] - RTC, EEPROM, GPIO, TOUCH SCREEN (U19.1), [15] - MISC, JTAG, HEADERS (J34.2 R178.1)
GPIO1: [14] - RTC, EEPROM, GPIO, TOUCH SCREEN (U19.2), [15] - MISC, JTAG, HEADERS (J34.3 R177.1)
GPIO2: [14] - RTC, EEPROM, GPIO, TOUCH SCREEN (U19.3), [15] - MISC, JTAG, HEADERS (J34.4 R179.1)
GPIO3: [14] - RTC, EEPROM, GPIO, TOUCH SCREEN (U19.4), [15] - MISC, JTAG, HEADERS (J34.5 R180.2)
GPIO4: [14] - RTC, EEPROM, GPIO, TOUCH SCREEN (U19.5), [15] - MISC, JTAG, HEADERS (J34.6 R182.2)
GPIO5: [14] - RTC, EEPROM, GPIO, TOUCH SCREEN (U19.6), [15] - MISC, JTAG, HEADERS (J34.7 R181.2)
GPIO6: [14] - RTC, EEPROM, GPIO, TOUCH SCREEN (U19.7), [15] - MISC, JTAG, HEADERS (J33.7 R175.1)
GPIO7: [14] - RTC, EEPROM, GPIO, TOUCH SCREEN (U19.8), [15] - MISC, JTAG, HEADERS (J33.9 R176.2)
HDMI_CEC_IN: [03] - CONNECTORS (J1.44), [07] - HDMI (U7.16)
HDMI_CLK_N: [03] - CONNECTORS (J1.45), [07] - HDMI (J16.12 U7.15 U7.24)
HDMI_CLK_P: [03] - CONNECTORS (J1.47), [07] - HDMI (J16.10 U7.13 U7.26)
HDMI_D0_N: [03] - CONNECTORS (J1.39), [07] - HDMI (J16.9 U7.12 U7.27)
HDMI_D0_P: [03] - CONNECTORS (J1.41), [07] - HDMI (J16.7 U7.10 U7.29)
HDMI_D1_N: [03] - CONNECTORS (J1.46), [07] - HDMI (J16.6 U7.9 U7.30)
HDMI_D1_P: [03] - CONNECTORS (J1.48), [07] - HDMI (J16.4 U7.7 U7.32)
HDMI_D2_N: [03] - CONNECTORS (J1.40), [07] - HDMI (J16.3 U7.6 U7.33)
HDMI_D2_P: [03] - CONNECTORS (J1.42), [07] - HDMI (J16.1 U7.4 U7.35)
HDMI_HPD: [03] - CONNECTORS (J1.43), [07] - HDMI (U7.19)
HP_AMP_OUTL: [05] - PCIE MINI 2, AUDIO2 (U4.16), [11] - AUDIO1 (R89.1)
HP_AMP_OUTR: [05] - PCIE MINI 2, AUDIO2 (U4.15), [11] - AUDIO1 (R88.1)
HP_INL: [05] - PCIE MINI 2, AUDIO2 (U4.27), [11] - AUDIO1 (C136.2)
HP_INR: [05] - PCIE MINI 2, AUDIO2 (U4.26), [11] - AUDIO1 (C138.2)
I2C1_SCL: [03] - CONNECTORS (J2.14), [11] - AUDIO1 (U14.29)
I2C1_SDA: [03] - CONNECTORS (J2.12), [11] - AUDIO1 (U14.27)
I2C2_SCL: [03] - CONNECTORS (J1.36), [04] - PCIE MINI 1, PCIE (J3.B5 J4.30), [05] - PCIE MINI 2, AUDIO2 (J9.30 U6.6), [07] - HDMI (U7.17), [14] - RTC, EEPROM, GPIO, TOUCH SCREEN (5 pins)
I2C2_SDA: [03] - CONNECTORS (J1.38), [04] - PCIE MINI 1, PCIE (J3.B6 J4.32), [05] - PCIE MINI 2, AUDIO2 (J9.32 U6.5), [07] - HDMI (U7.18), [14] - RTC, EEPROM, GPIO, TOUCH SCREEN (5 pins)
I2C3_SCL: [03] - CONNECTORS (J2.19), [15] - MISC, JTAG, HEADERS (J34.10)
I2C3_SDA: [03] - CONNECTORS (J2.17), [15] - MISC, JTAG, HEADERS (J34.8)
JTAG_nTRST: [03] - CONNECTORS (J2.41), [15] - MISC, JTAG, HEADERS (J36.3)
JTAG_TCK: [03] - CONNECTORS (J2.43), [15] - MISC, JTAG, HEADERS (J36.9)
JTAG_TDI: [03] - CONNECTORS (J2.47), [15] - MISC, JTAG, HEADERS (J36.5)
JTAG_TDO: [03] - CONNECTORS (J2.45), [15] - MISC, JTAG, HEADERS (J36.13)
JTAG_TMS: [03] - CONNECTORS (J2.49), [15] - MISC, JTAG, HEADERS (J36.7)
LVDS0_CABC: [03] - CONNECTORS (J2.6), [08] - LVDS (U23.1 U23.2)
LVDS0_CLK_N: [03] - CONNECTORS (J2.13), [08] - LVDS (J41.14)
LVDS0_CLK_P: [03] - CONNECTORS (J2.15), [08] - LVDS (J41.15)
LVDS0_PWM: [03] - CONNECTORS (J2.5), [08] - LVDS (R58.2)
LVDS0_TX0_N: [03] - CONNECTORS (J2.2), [08] - LVDS (J41.5)
LVDS0_TX0_P: [03] - CONNECTORS (J2.4), [08] - LVDS (J41.6)
LVDS0_TX1_N: [03] - CONNECTORS (J2.8), [08] - LVDS (J41.8)
LVDS0_TX1_P: [03] - CONNECTORS (J2.10), [08] - LVDS (J41.9)
LVDS0_TX2_N: [03] - CONNECTORS (J2.1), [08] - LVDS (J41.11)
LVDS0_TX2_P: [03] - CONNECTORS (J2.3), [08] - LVDS (J41.12)
LVDS0_TX3_N: [03] - CONNECTORS (J2.7), [08] - LVDS (J41.19)
LVDS0_TX3_P: [03] - CONNECTORS (J2.9), [08] - LVDS (J41.20)
LVDS_BLON: [08] - LVDS (R165.1 R166.2 U8.1 U8.2), [14] - RTC, EEPROM, GPIO, TOUCH SCREEN (U19.15)
LVDS_EN: [08] - LVDS (R167.1 R168.2 U9.4), [14] - RTC, EEPROM, GPIO, TOUCH SCREEN (U19.14)
MPCIE1_WDISn: [04] - PCIE MINI 1, PCIE (J4.20 R73.1), [14] - RTC, EEPROM, GPIO, TOUCH SCREEN (U19.11)
MPCIE2_WDISn: [05] - PCIE MINI 2, AUDIO2 (J9.20 R150.1), [14] - RTC, EEPROM, GPIO, TOUCH SCREEN (U19.12)
ON_OFF: [03] - CONNECTORS (J1.6), [14] - RTC, EEPROM, GPIO, TOUCH SCREEN (Q7.3), [17] - PWR IN, LEDS, BUTTONS, MECH (R143.2)
PCIE_HPDETn: [04] - PCIE MINI 1, PCIE (J3.B17 R15.1), [14] - RTC, EEPROM, GPIO, TOUCH SCREEN (U19.10)
PCIE_RX_N: [03] - CONNECTORS (J2.52), [04] - PCIE MINI 1, PCIE (R5.1 R7.1)
PCIE_RX_P: [03] - CONNECTORS (J2.54), [04] - PCIE MINI 1, PCIE (R8.1 R9.1)
PCIE_TX_N: [03] - CONNECTORS (J2.51), [04] - PCIE MINI 1, PCIE (R10.1 R12.1)
PCIE_TX_P: [03] - CONNECTORS (J2.53), [04] - PCIE MINI 1, PCIE (R14.1 R16.1)
PCIE_WAKE: [03] - CONNECTORS (J2.39), [04] - PCIE MINI 1, PCIE (J3.B11 J4.1 R151.1)
POK_1V5: [04] - PCIE MINI 1, PCIE (R152.1 R153.1 U1.3), [05] - PCIE MINI 2, AUDIO2 (U3.5)
POK_3V3: [04] - PCIE MINI 1, PCIE (R184.1 U1.5), [16] - POWERS 5V, 3V3 (R138.1)
POKn: [04] - PCIE MINI 1, PCIE (R153.2 R184.2), [05] - PCIE MINI 2, AUDIO2 (U3.3), [15] - MISC, JTAG, HEADERS (R117.1 U21.1), [17] - PWR IN, LEDS, BUTTONS, MECH (Q4.1)
PWR_BTN_HDR: [15] - MISC, JTAG, HEADERS (J33.3), [17] - PWR IN, LEDS, BUTTONS, MECH (R142.2 SW2.2)
PWR_LED_HDR: [15] - MISC, JTAG, HEADERS (J33.2), [17] - PWR IN, LEDS, BUTTONS, MECH (R144.1)
RST_BTN_HDR: [15] - MISC, JTAG, HEADERS (J33.5), [17] - PWR IN, LEDS, BUTTONS, MECH (R140.1 R141.2 SW1.2)
RST_BTNn: [15] - MISC, JTAG, HEADERS (U24.1), [17] - PWR IN, LEDS, BUTTONS, MECH (C198.1 R141.1)
SATA_CFAST_CDI: [06] - SATA, CFAST (J15.PC1 R44.1), [14] - RTC, EEPROM, GPIO, TOUCH SCREEN (U19.13)
SATA_RX_N: [03] - CONNECTORS (J2.58), [06] - SATA, CFAST (R36.1 R37.1)
SATA_RX_P: [03] - CONNECTORS (J2.60), [06] - SATA, CFAST (R38.1 R39.1)
SATA_TX_N: [03] - CONNECTORS (J2.57), [06] - SATA, CFAST (R40.1 R41.1)
SATA_TX_P: [03] - CONNECTORS (J2.59), [06] - SATA, CFAST (R42.1 R43.1)
SD2_ACT: [03] - CONNECTORS (J2.11), [12] - SD (Q1.1)
SD2_CD: [03] - CONNECTORS (J2.38), [12] - SD (J39.9 R104.2)
SD2_CLK: [03] - CONNECTORS (J2.36), [12] - SD (J39.5)
SD2_CMD: [03] - CONNECTORS (J2.21), [12] - SD (J39.3)
SD2_DATA0: [03] - CONNECTORS (J2.26), [12] - SD (J39.7)
SD2_DATA1: [03] - CONNECTORS (J2.23), [12] - SD (J39.8)
SD2_DATA2: [03] - CONNECTORS (J2.28), [12] - SD (J39.1)
SD2_DATA3: [03] - CONNECTORS (J2.25), [12] - SD (J39.2)
SD2_WP: [03] - CONNECTORS (J2.34), [12] - SD (JP3.1)
SD3_CD: [03] - CONNECTORS (J1.34), [12] - SD (J29.9 R106.2)
SD3_CLK: [03] - CONNECTORS (J1.27), [12] - SD (J29.5)
SD3_CMD: [03] - CONNECTORS (J1.33), [12] - SD (J29.3)
SD3_DATA0: [03] - CONNECTORS (J1.29), [12] - SD (J29.7)
SD3_DATA1: [03] - CONNECTORS (J1.30), [12] - SD (J29.8)
SD3_DATA2: [03] - CONNECTORS (J1.31), [12] - SD (J29.1)
SD3_DATA3: [03] - CONNECTORS (J1.32), [12] - SD (J29.2)
SD3_WP: [03] - CONNECTORS (J1.25), [12] - SD (R105.2)
SYS_POKn: [03] - CONNECTORS (J1.8), [15] - MISC, JTAG, HEADERS (U21.4)
SYS_RSTn: [03] - CONNECTORS (J1.7), [15] - MISC, JTAG, HEADERS (U20.1 U20.2)
TRD0_N: [03] - CONNECTORS (J1.57), [10] - ETHERNET (T1.12)
TRD0_P: [03] - CONNECTORS (J1.59), [10] - ETHERNET (T1.11)
TRD1_N: [03] - CONNECTORS (J1.51), [10] - ETHERNET (T1.6)
TRD1_P: [03] - CONNECTORS (J1.53), [10] - ETHERNET (T1.5)
TRD2_N: [03] - CONNECTORS (J1.58), [10] - ETHERNET (T1.9)
TRD2_P: [03] - CONNECTORS (J1.60), [10] - ETHERNET (T1.8)
TRD3_N: [03] - CONNECTORS (J1.52), [10] - ETHERNET (T1.3)
TRD3_P: [03] - CONNECTORS (J1.54), [10] - ETHERNET (T1.2)
TSC_INT: [03] - CONNECTORS (J1.35), [14] - RTC, EEPROM, GPIO, TOUCH SCREEN (R174.1)
UART1_CTS: [03] - CONNECTORS (J1.11), [13] - UARTS (U16.18)
UART1_DCD: [03] - CONNECTORS (J1.16), [13] - UARTS (U16.14)
UART1_DSR: [03] - CONNECTORS (J1.9), [13] - UARTS (U16.13)
UART1_DTR: [03] - CONNECTORS (J1.15), [13] - UARTS (U16.10)
UART1_RI: [03] - CONNECTORS (J1.10), [13] - UARTS (U16.17)
UART1_RTS: [03] - CONNECTORS (J1.13), [13] - UARTS (U16.11)
UART1_RXD: [03] - CONNECTORS (J1.14), [13] - UARTS (U16.15)
UART1_TXD: [03] - CONNECTORS (J1.12), [13] - UARTS (U16.12)
UART2_CTS: [03] - CONNECTORS (J2.31), [13] - UARTS (J31.6)
UART2_RTS: [03] - CONNECTORS (J2.33), [13] - UARTS (J31.4)
UART2_RXD: [03] - CONNECTORS (J2.35), [13] - UARTS (J31.3)
UART2_TXD: [03] - CONNECTORS (J2.37), [13] - UARTS (J31.5)
USB0_ID: [03] - CONNECTORS (J1.20), [09] - USB (D19.1 J21.4 JP1.1 R74.1)
USB0_N: [03] - CONNECTORS (J1.22), [09] - USB (R62.1 R63.1)
USB0_P: [03] - CONNECTORS (J1.24), [09] - USB (R65.1 R67.1)
USB1_N: [03] - CONNECTORS (J2.40), [09] - USB (R64.1 R66.1)
USB1_P: [03] - CONNECTORS (J2.42), [09] - USB (R68.1 R69.1)
USB1_PWR_EN: [03] - CONNECTORS (J2.44), [09] - USB (U12.4)
USB_MPCIE1_N: [04] - PCIE MINI 1, PCIE (L1.4), [09] - USB (R66.2)
USB_MPCIE1_P: [04] - PCIE MINI 1, PCIE (L1.3), [09] - USB (R69.2)
USB_MPCIE2_N: [05] - PCIE MINI 2, AUDIO2 (L2.4), [09] - USB (U13.8)
USB_MPCIE2_P: [05] - PCIE MINI 2, AUDIO2 (L2.3), [09] - USB (U13.9)
USB_OC: [03] - CONNECTORS (J1.28), [09] - USB (U12.3)
USER_LED_HDR: [15] - MISC, JTAG, HEADERS (J33.4), [17] - PWR IN, LEDS, BUTTONS, MECH (R148.1)
USR_BTNn: [14] - RTC, EEPROM, GPIO, TOUCH SCREEN (U19.17), [17] - PWR IN, LEDS, BUTTONS, MECH (C200.1 R149.1)
USR_LEDn: [14] - RTC, EEPROM, GPIO, TOUCH SCREEN (U19.16), [17] - PWR IN, LEDS, BUTTONS, MECH (Q5.1 R183.1)

## Assembly variants
Prototype: not fitted C16 C21 C26 C36 C95 C136 C138 C152 C153 C154 C155 C207 C208 C209 C210 C211 C212 C215 C217 D20 FB10 FB26 Q6 Q7 R1 R3 R5 R8 R10 R14 R24 R33 R36 R38 R40 R42 R52 R55 R59 R62 R64 R65 R68 R74 R75 R76 R88 R89 R104 R106 R111 R112 R113 R114 R116 R124 R125 R133 R151 R153 R154 R155 R156 R158 R160 R161 R162 R166 R168 R170 R171 R173 R174 R184 R185 U15